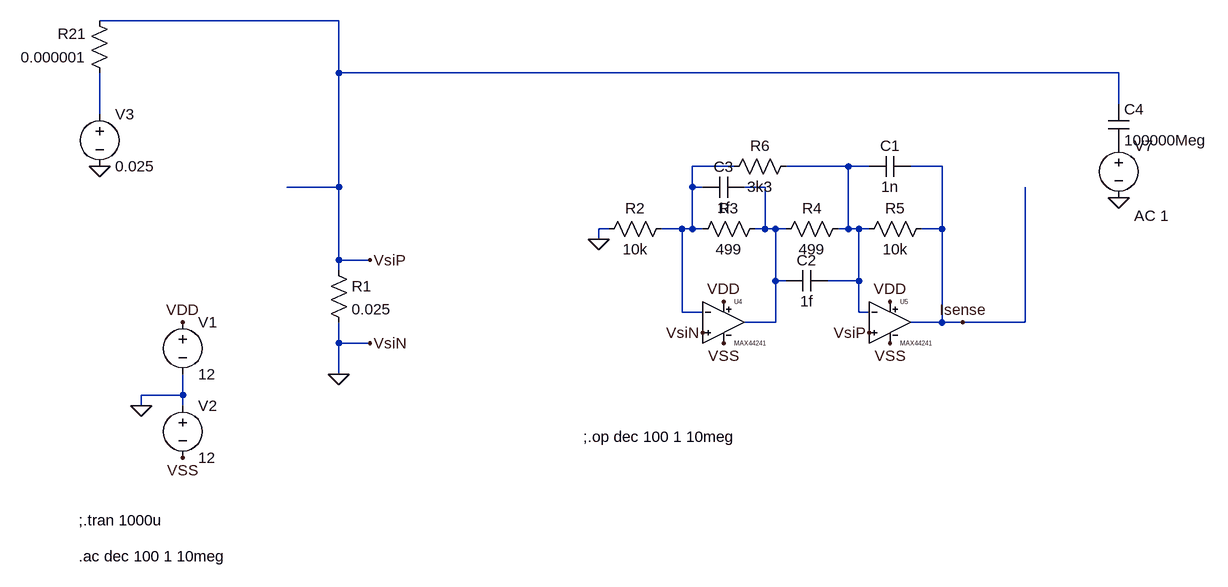
[diagram p0: schematic max44241_diff_amp.asc]
max44241_diff_amp.asc, the LTspice schematic file:
Version 4
SHEET 1 1884 680
WIRE -352 -176 -720 -176
WIRE -352 -96 -352 -176
WIRE 848 -96 -352 -96
WIRE 848 -48 848 -96
WIRE -720 -32 -720 -96
WIRE 256 48 192 48
WIRE 432 48 336 48
WIRE 464 48 432 48
WIRE 576 48 528 48
WIRE -352 80 -352 -96
WIRE -352 80 -432 80
WIRE 192 80 192 48
WIRE 208 80 192 80
WIRE 304 80 272 80
WIRE 64 144 48 144
WIRE 176 144 144 144
WIRE 192 144 192 80
WIRE 192 144 176 144
WIRE 208 144 192 144
WIRE 304 144 304 80
WIRE 304 144 288 144
WIRE 320 144 304 144
WIRE 336 144 320 144
WIRE 432 144 432 48
WIRE 432 144 416 144
WIRE 448 144 432 144
WIRE 464 144 448 144
WIRE 576 144 576 48
WIRE 576 144 544 144
WIRE 48 160 48 144
WIRE -352 192 -352 80
WIRE -304 192 -352 192
WIRE -352 208 -352 192
WIRE 320 224 320 144
WIRE 336 224 320 224
WIRE 448 224 448 144
WIRE 448 224 400 224
WIRE 176 272 176 144
WIRE 208 272 176 272
WIRE 448 272 448 224
WIRE 464 272 448 272
WIRE 320 288 320 224
WIRE 320 288 272 288
WIRE 576 288 576 144
WIRE 576 288 528 288
WIRE 608 288 576 288
WIRE 704 288 704 80
WIRE 704 288 608 288
WIRE -352 320 -352 288
WIRE -304 320 -352 320
WIRE -352 368 -352 320
WIRE -592 400 -592 368
WIRE -592 400 -656 400
WIRE -656 416 -656 400
WIRE -592 416 -592 400
FLAG -352 368 0
FLAG -592 288 VDD
FLAG -592 496 VSS
FLAG -656 416 0
FLAG 240 256 VDD
FLAG 496 256 VDD
FLAG 240 320 VSS
FLAG 496 320 VSS
FLAG 48 160 0
FLAG -304 192 VsiP
FLAG 464 304 VsiP
FLAG -304 320 VsiN
FLAG 208 304 VsiN
FLAG 608 288 Isense
FLAG -720 48 0
FLAG 848 96 0
DATAFLAG -352 320 ""
DATAFLAG -352 192 ""
DATAFLAG 384 48 ""
DATAFLAG 704 208 ""
DATAFLAG 192 48 ""
SYMBOL res -368 192 R0
SYMATTR InstName R1
SYMATTR Value 0.025
SYMBOL res 160 128 R90
WINDOW 0 0 56 VBottom 2
WINDOW 3 32 56 VTop 2
SYMATTR InstName R2
SYMATTR Value 10k
SYMBOL res 304 128 R90
WINDOW 0 0 56 VBottom 2
WINDOW 3 32 56 VTop 2
SYMATTR InstName R3
SYMATTR Value 499
SYMBOL res 432 128 R90
WINDOW 0 0 56 VBottom 2
WINDOW 3 32 56 VTop 2
SYMATTR InstName R4
SYMATTR Value 499
SYMBOL res 560 128 R90
WINDOW 0 0 56 VBottom 2
WINDOW 3 32 56 VTop 2
SYMATTR InstName R5
SYMATTR Value 10k
SYMBOL res 352 32 R90
WINDOW 0 0 56 VBottom 2
WINDOW 3 32 56 VTop 2
SYMATTR InstName R6
SYMATTR Value 3k3
SYMBOL voltage -592 272 R0
WINDOW 123 0 0 Left 2
WINDOW 39 0 0 Left 2
SYMATTR InstName V1
SYMATTR Value 12
SYMBOL voltage -592 400 R0
WINDOW 123 0 0 Left 2
WINDOW 39 0 0 Left 2
SYMATTR InstName V2
SYMATTR Value 12
SYMBOL voltage -720 -48 R0
WINDOW 123 24 124 Left 2
WINDOW 39 0 0 Left 2
SYMATTR InstName V3
SYMATTR Value 0.025
SYMBOL cap 528 32 R90
WINDOW 0 0 32 VBottom 2
WINDOW 3 32 32 VTop 2
SYMATTR InstName C1
SYMATTR Value 1n
SYMBOL res -704 -80 R180
WINDOW 0 36 76 Left 2
WINDOW 3 36 40 Left 2
SYMATTR InstName R21
SYMATTR Value 0.000001
SYMBOL cap 832 -48 R0
SYMATTR InstName C4
SYMATTR Value 100000Meg
SYMBOL voltage 848 0 R0
WINDOW 123 24 124 Left 2
WINDOW 39 0 0 Left 0
SYMATTR Value2 AC 1
SYMATTR InstName V7
SYMATTR Value ""
SYMBOL MAX44241 240 224 R0
SYMATTR InstName U4
SYMBOL MAX44241 496 224 R0
SYMATTR InstName U5
SYMBOL cap 400 208 R90
WINDOW 0 0 32 VBottom 2
WINDOW 3 32 32 VTop 2
SYMATTR InstName C2
SYMATTR Value 1f
SYMBOL cap 272 64 R90
WINDOW 0 0 32 VBottom 2
WINDOW 3 32 32 VTop 2
SYMATTR InstName C3
SYMATTR Value 1f
TEXT -752 592 Left 2 !;.tran 1000u
TEXT -752 648 Left 2 !.ac dec 100 1 10meg
TEXT 24 464 Left 2 !;.op dec 100 1 10meg

The netlist it stands for:
* max44241_diff_amp.asc
R1 VsiP 0 0.025
R2 N002 0 10k
R3 N004 N002 499
R4 N003 N004 499
R5 Isense N003 10k
R6 N003 N002 3k3
V1 VDD 0 12
V2 0 VSS 12
V3 N001 0 0.025
C1 Isense N003 1n
R21 N001 VsiP 0.000001
C4 VsiP P001 100000Meg
V7 P001 0 AC 1
XU4 0 N002 VDD VSS N004 MAX44241  ; pins INA+ INA- VDD VSS OUTA
XU5 VsiP N003 VDD VSS Isense MAX44241  ; pins INA+ INA- VDD VSS OUTA
C2 N003 N004 1f
C3 N004 N002 1f
;.tran 1000u
.ac dec 100 1 10meg
;.op dec 100 1 10meg
.lib MAX44241.lib
.backanno
.end